# Altium project carte_pami27v2.PrjPcb
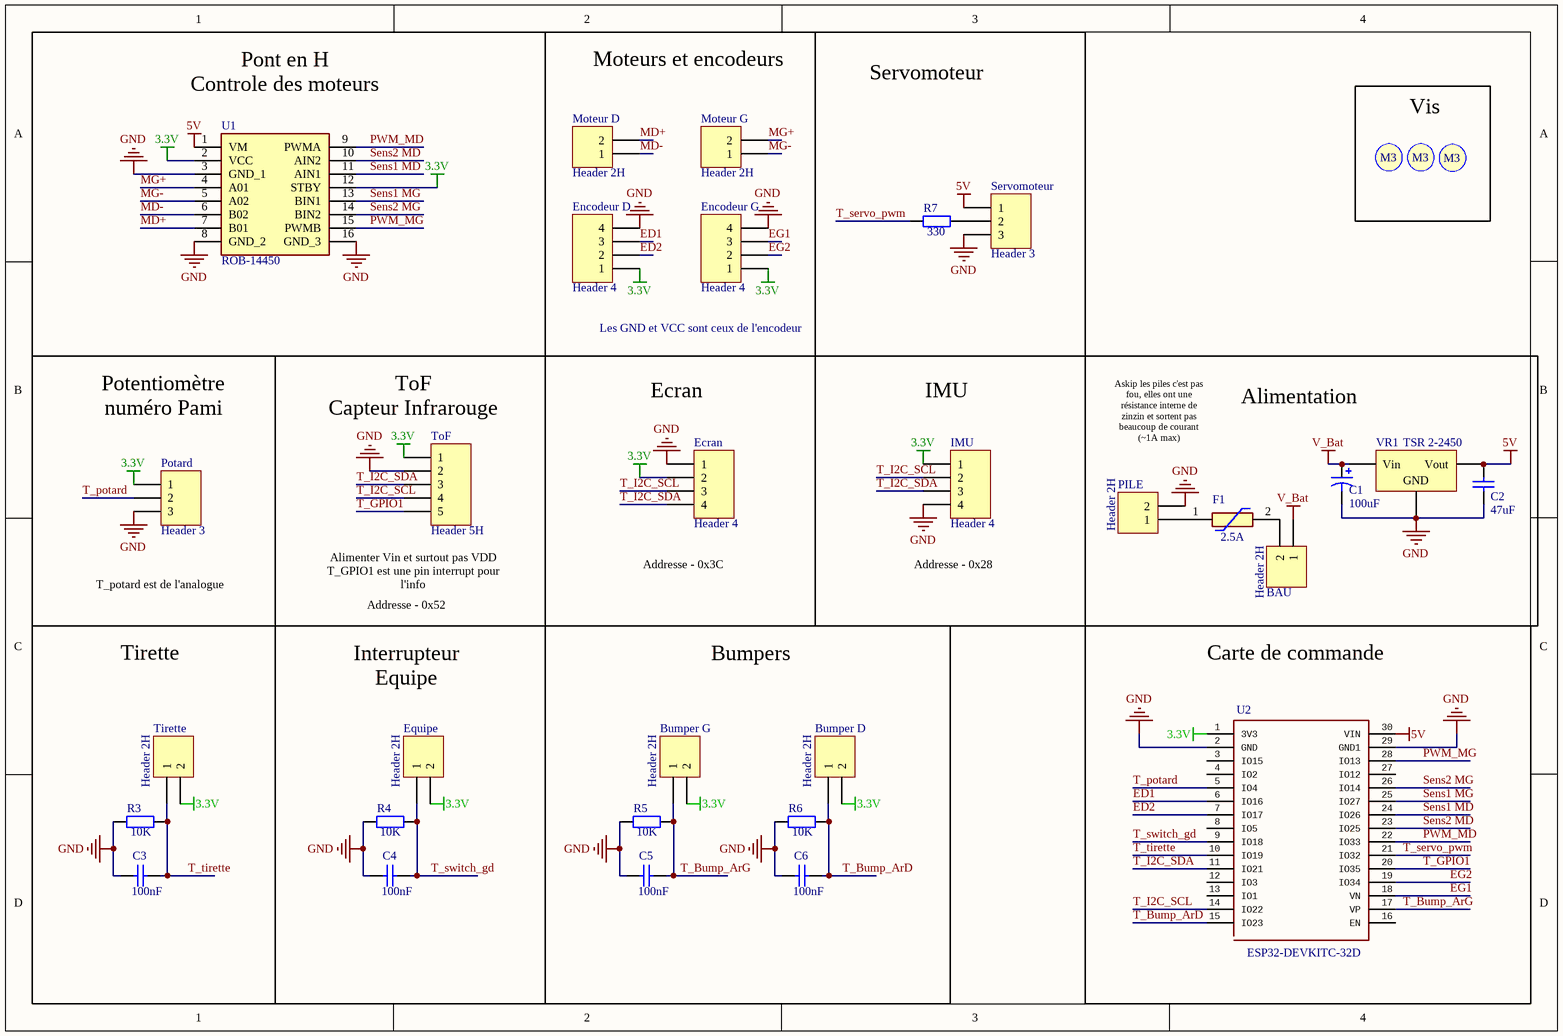
[diagram p0: carte_pami27v2.SchDoc]
1 sheet, 33 parts. Net scope: global (net labels, ports and power ports of the same name join across sheets).
Board file: carte_pami27v2.1.PcbDoc

## Sheet carte_pami27v2.SchDoc
size A4; SheetNumber: 1; SheetTotal: 1

### Parts
BAU  Header 2H  [JST XH B2B-XH-A]
Bumper_D  Header 2H  [JST XH B2B-XH-A]
Bumper_G  Header 2H  [JST XH B2B-XH-A]
C1  value 100uF  [Condensateur]  (hidden comment: 35V)
C2  value 47uF  [Capacitor 1206]  (hidden comment: Cap)
C3  value 100nF  [Capacitor 1206]  (hidden comment: Cap)
C4  value 100nF  [Capacitor 1206]  (hidden comment: Cap)
C5  value 100nF  [Capacitor 1206]  (hidden comment: Cap)
C6  value 100nF  [Capacitor 1206]  (hidden comment: Cap)
Ecran  Header 4  [JST XH B4B-XH-A]
Encodeur_D  Header 4  [JST XH B4B-XH-A]
Encodeur_G  Header 4  [JST XH B4B-XH-A]
Equipe  Header 2H  [JST XH B2B-XH-A]
F1  2.5A  [MFR250014]
IMU  Header 4  [JST XH B4B-XH-A]
Moteur_D  Header 2H  [JST XH B2B-XH-A]
Moteur_G  Header 2H  [JST XH B2B-XH-A]
PILE  Header 2H  [JST XH B2B-XH-A]
Potard  Header 3  [JST XH B3B-XH-A]
R3  value 10K  [Resistor 1206]  (hidden comment: Res2)
R4  value 10K  [Resistor 1206]  (hidden comment: Res2)
R5  value 10K  [Resistor 1206]  (hidden comment: Res2)
R6  value 10K  [Resistor 1206]  (hidden comment: Res2)
R7  value 330  [Resistor 1206]  (hidden comment: Res2)
S1  Screw M3  [Screw M3]  (value not drawn)
S2  Screw M3  [Screw M3]  (value not drawn)
S3  Screw M3  [Screw M3]  (value not drawn)
Servomoteur  Header 3  [JST XH B3B-XH-A]
Tirette  Header 2H  [JST XH B2B-XH-A]
ToF  Header 5H  [JST XH B5B-XH-A]
U1  ROB-14450  [ROB14450]
U2  ESP32-DEVKITC-32D  [ESP32-DEVKITV1]
VR1  TSR 2-2450  [TRS]

### Blocks framed on the sheet
Moteurs et encodeurs: Encodeur_D Encodeur_G Moteur_D Moteur_G
Servomoteur: R7 Servomoteur
Vis: S1-S3
Alimentation: BAU C1 C2 F1 PILE VR1
Tirette: C3 R3 Tirette
Carte de commande: U2

### Nets
3.3V: Bumper_D.2 Bumper_G.2 Ecran.2 Encodeur_D.1 Encodeur_G.1 Equipe.2 IMU.1 Potard.1 Tirette.2 ToF.1 U1.2(VCC) U1.12(STBY) U2.1(3V3)
5V: C2.2 Servomoteur.1 U1.1(VM) U2.30(VIN) VR1.3(Vout)
GND: C1.2 C2.1 C3.1 C4.1 C5.1 C6.1 Ecran.1 Encodeur_D.4 Encodeur_G.4 IMU.4 PILE.2 Potard.3 R3.1 R4.1 R5.1 R6.1 Servomoteur.3 ToF.2 U1.3(GND_1) U1.8(GND_2) U1.16(GND_3) U2.2(GND) U2.29(GND1) VR1.2(GND)
V_Bat: BAU.1 C1.1 VR1.1(Vin)
ED1: Encodeur_D.3 U2.6(IO16)
ED2: Encodeur_D.2 U2.7(IO17)
EG1: Encodeur_G.3 U2.18(VN)
EG2: Encodeur_G.2 U2.19(IO34)
MD+: Moteur_D.2 U1.7(B01)
MD-: Moteur_D.1 U1.6(B02)
MG+: Moteur_G.2 U1.4(A01)
MG-: Moteur_G.1 U1.5(A02)
PWM_MD: U1.9(PWMA) U2.22(IO33)
PWM_MG: U1.15(PWMB) U2.28(IO13)
Sens1 MD: U1.11(AIN1) U2.24(IO26)
Sens1 MG: U1.13(BIN1) U2.25(IO27)
Sens2 MD: U1.10(AIN2) U2.23(IO25)
Sens2 MG: U1.14(BIN2) U2.26(IO14)
T_Bump_ArD: Bumper_D.1 C6.2 R6.2 U2.15(IO23)
T_Bump_ArG: Bumper_G.1 C5.2 R5.2 U2.17(VP)
T_GPIO1: ToF.5 U2.20(IO35)
T_I2C_SCL: Ecran.3 IMU.2 ToF.4 U2.14(IO22)
T_I2C_SDA: Ecran.4 IMU.3 ToF.3 U2.11(IO21)
T_potard: Potard.2 U2.5(IO4)
T_servo_pwm: R7.1 U2.21(IO32)
T_switch_gd: C4.2 Equipe.1 R4.2 U2.9(IO18)
T_tirette: C3.2 R3.2 Tirette.1 U2.10(IO19)
NetBAU_2: BAU.2 F1.2
NetF1_1: F1.1 PILE.1
NetR7_2: R7.2 Servomoteur.2

Not connected (* = marked no-connect by the designer): U2 3(IO15) 4(IO2) 8(IO5) 12(IO3) 13(IO1) 16(EN) 27(IO12)

### Notes on the sheet
- Pont en H
  Controle des moteurs
- Les GND et VCC sont ceux de l'encodeur
- Potentiomètre
  numéro Pami
- (near ToF) ToF
  Capteur Infrarouge
- Ecran
- IMU
- Askip les piles c'est pas fou, elles ont une résistance interne de zinzin et sortent pas beaucoup de courant (~1A max)
- (near Ecran) Addresse - 0x3C
- (near IMU) Addresse - 0x28
- T_potard est de l'analogue
- (near ToF) Alimenter Vin et surtout pas VDD
  T_GPIO1 est une pin interrupt pour l'info
- Addresse - 0x52
- Interrupteur
  Equipe
- Bumpers
- (in symbol Screw M3) M3

### Library data of the parts
BAU Bumper_D Bumper_G Equipe Moteur_D Moteur_G PILE Tirette = Header 2H: Header, 2-Pin, Right Angle; LatestRevisionDate: 17-Jul-2002; LatestRevisionNote: Re-released for DXP Platform.; Publisher: Altium Limited
C1 = Cap Pol1: Polarized Capacitor (Radial); Published: 8-Jun-2000; LatestRevisionDate: 17-Jul-2002; LatestRevisionNote: Re-released for DXP Platform.; PackageReference: RB7.6-15; Publisher: Altium Limited; PackageDescription: Polarized Capacitor (Radial); 2 Leads
C2-C6 = Cap: Capacitor; Published: 8-Jun-2000; LatestRevisionDate: 17-Jul-2002; LatestRevisionNote: Re-released for DXP Platform.; PackageReference: RAD-0.3; Publisher: Altium Limited; PackageDescription: Radial Cap, Thru-Hole; 2 Leads; 0.3 in Pin Spacing
Ecran Encodeur_D Encodeur_G IMU = Header 4: Header, 4-Pin; LatestRevisionDate: 17-Jul-2002; LatestRevisionNote: Re-released for DXP Platform.; Publisher: Altium Limited
F1 = MF-R250-0-14: Resettable Fuse / MF-R250-0-14; Manufacturer_Name: Bourns; Datasheet Link: https://www.bourns.com/pdfs/mfr.pdf; Height: 18.3mm; Manufacturer_Part_Number: MF-R250-0-14; Mouser Part Number: 652-MF-R250-0-14; Mouser Price/Stock: https://www.mouser.co.uk/ProductDetail/Bourns/MF-R250-0-14?qs=934AWm7UsBMVwGh3q9pGfQ%3D%3D; Arrow Part Number: MF-R250-0-14; Arrow Price/Stock: https://www.arrow.com/en/products/mf-r250-0-14/bourns?utm_currency=USD&region=nac
Potard Servomoteur = Header 3: Header, 3-Pin; LatestRevisionDate: 17-Jul-2002; LatestRevisionNote: Re-released for DXP Platform.; Publisher: Altium Limited
R3-R7 = Res2: Resistor; Published: 8-Jun-2000; LatestRevisionDate: 17-Jul-2002; LatestRevisionNote: Re-released for DXP Platform.; PackageReference: AXIAL-0.4; Publisher: Altium Limited; PackageDescription: Axial Device, Thru-Hole; 2 Leads; 0.4 in Pin Spacing
ToF = Header 5H: Header, 5-Pin, Right Angle; LatestRevisionDate: 17-Jul-2002; LatestRevisionNote: Re-released for DXP Platform.; Publisher: Altium Limited
U1 = ROB-14450: Undefined or Miscellaneous; Manufacturer_Name: SparkFun; Datasheet Link: https://www.sparkfun.com/products/14450; Height: 5mm; Manufacturer_Part_Number: ROB-14450; Mouser Part Number: 474-ROB-14450; Mouser Price/Stock: https://www.mouser.co.uk/ProductDetail/SparkFun/ROB-14450?qs=wd5RIQLrsJhQdlH%2FW5H2aQ%3D%3D; Arrow Part Number: ROB-14450; Arrow Price/Stock: https://www.arrow.com/en/products/rob-14450/sparkfun-electronics?region=nac
U2 = ESP32-DEVKITC-32D: Eval Board For Esp-Wroom-32; MF: Espressif Systems; Availability: Unavailable; Package: None; SnapEDA_Link: https://www.snapeda.com/parts/ESP32-DEVKITC-32D/Espressif%20Systems/view-part/?ref=snap; MP: ESP32-DEVKITC-32D; Price: None; Value: *
VR1 = Volt Reg: Voltage Regulator; Published: 24-Mar-1999; LatestRevisionDate: 29-May-2009; LatestRevisionNote: IPC-7351 Footprint Added.; PackageReference: D2PAK; Publisher: Altium Limited; PackageDescription: 3-Pin Transistor Outline Package 2.54 mm Pitch, 15.1 mm Lead Span